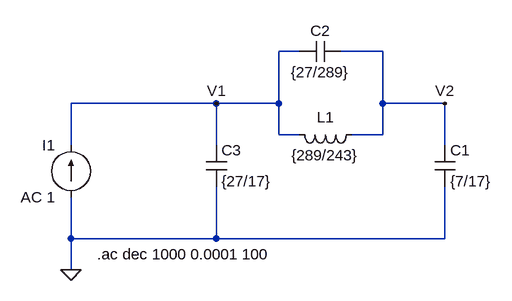
[diagram p0: schematic punto2_circuito_cuadripolo_z21.asc]
punto2_circuito_cuadripolo_z21.asc, the LTspice schematic file:
Version 4
SHEET 1 1480 1040
WIRE 416 -32 384 -32
WIRE 544 -32 480 -32
WIRE 288 48 64 48
WIRE 384 48 384 -32
WIRE 384 48 288 48
WIRE 544 48 544 -32
WIRE 640 48 544 48
WIRE 384 96 384 48
WIRE 416 96 384 96
WIRE 544 96 544 48
WIRE 544 96 496 96
WIRE 64 112 64 48
WIRE 288 112 288 48
WIRE 640 112 640 48
WIRE 64 256 64 192
WIRE 288 256 288 176
WIRE 288 256 64 256
WIRE 640 256 640 176
WIRE 640 256 288 256
WIRE 64 304 64 256
FLAG 64 304 0
FLAG 288 48 V1
FLAG 640 48 V2
SYMBOL current 64 192 R180
WINDOW 0 24 80 Left 2
WINDOW 3 24 0 Left 2
SYMATTR InstName I1
SYMATTR Value AC 1
SYMBOL cap 272 112 R0
SYMATTR InstName C3
SYMATTR Value {27/17}
SYMBOL cap 480 -48 R90
WINDOW 0 0 32 VBottom 2
WINDOW 3 32 32 VTop 2
SYMATTR InstName C2
SYMATTR Value {27/289}
SYMBOL cap 624 112 R0
SYMATTR InstName C1
SYMATTR Value {7/17}
SYMBOL ind 512 80 R90
WINDOW 0 5 56 VBottom 2
WINDOW 3 32 56 VTop 2
SYMATTR InstName L1
SYMATTR Value {289/243}
SYMATTR SpiceLine Rser=0
TEXT 104 280 Left 2 !.ac dec 1000 0.0001 100

The netlist it stands for:
* punto2_circuito_cuadripolo_z21.asc
I1 0 V1 AC 1
C3 V1 0 {27/17}
C2 V2 V1 {27/289}
C1 V2 0 {7/17}
L1 V2 V1 {289/243} Rser=0
.ac dec 1000 0.0001 100
.backanno
.end